# Altium schematic sheet 3V3_5V_LEVEL_SHIFTER.SchDoc
size A4; SheetNumber: 9; SheetTotal: 9
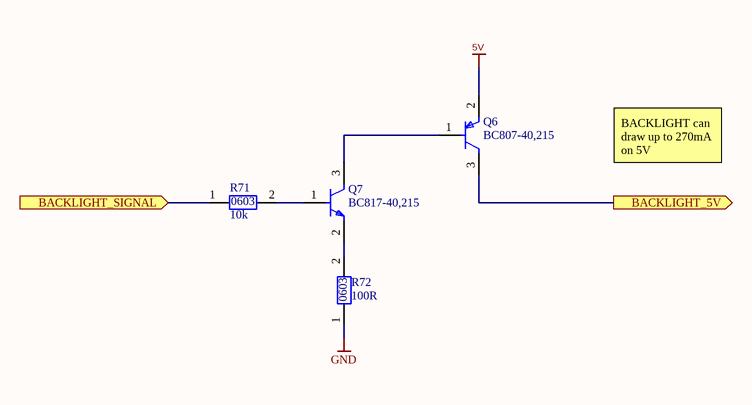
[diagram p0: 3V3_5V_LEVEL_SHIFTER.SchDoc]

## Parts
Q6  BC807-40,215  [FP-SOT23-IPC_B]
Q7  BC817-40,215  [FP-SOT23-MFG]
R71  SMD 0603 Resistor  [RESISTOR_SMD_0603]  (value not drawn)
R72  SMD 0603 Resistor  [RESISTOR_SMD_0603]  (value not drawn)

## Ports
BACKLIGHT_5V (out, see MAIN_SCHEMATIC[3A]), BACKLIGHT_SIGNAL (in, see MAIN_SCHEMATIC[2A], STM32[2B])

## Nets
5V: Q6.2(E)
GND: R72.1
BACKLIGHT_5V: Q6.3(C) ; port BACKLIGHT_5V
BACKLIGHT_SIGNAL: R71.1 ; port BACKLIGHT_SIGNAL
NetQ6_1: Q6.1(B) Q7.3(C)
NetQ7_1: Q7.1(B) R71.2
NetQ7_2: Q7.2(E) R72.2

## Notes on the sheet
- (near R71) 10k
- BACKLIGHT can draw up to 270mA on 5V
- (near R72) 100R
- (in symbol SMD 0603 Resistor) 0603

## Library data of the parts
Q6 = CMP-14406-000042-1: TRANS PNP 45V 500MA TO236AB; RoHS Compliant: Yes
Q7 = CMP-14406-000007-1: TRANS NPN 45V 0.5A SOT23; Manufacturer: Nexperia; Collector Emitter Saturation Voltage: 700mV; Power Dissipation: 250mW; Collector Base Voltage: 50V; Unity Gain Freq: 100MHz; Hfe Max: 600; Rthja Max: 500K/W; Emitter Base Voltage: 5V; Max Collector Current: 500mA; Hfe Testvce: 1V; Automotive Grade: Grade 0; Hfe Min: 250; Max Junction Temp: +150°C; Number Of Npn: 1; Hfe Testic: 100mA; Octopart: https://octopart.com/bc817-40%2C215-nexperia-78739081; Lead Free: Yes; Ipc Land Pattern Name: SOT95P230X100-3; Manufacturer Part Number: BC817-40,215; RoHS: TRUE; Collector Emitter Breakdown Voltage: 45V; Digikey Description: TRANS NPN 45V 0.5A SOT23; ComponentLink2URL: https://assets.nexperia.com/documents/data-sheet/BC817_SER.pdf; Temperature Range High: +150°C; Mouser Description: BC817 Series 45 V 500 mA 250 mW SMT NPN General-Purpose Transistor - SOT-23-; Device Class L3: BJTs; Temperature: to +150°C; Height: 1.1mm; Automotive: Yes; Ambient Temperature Range Low: -65°C; Package: SOT23; Collector Emitter Voltage: 45V; Category: Trans; ComponentLink2Description: Datasheet; Device Class L2: Transistors; Ambient Temperature Range High: +150°C; Number Of Elements: 1; Device Class L1: Discrete Semiconductors; Footprint Url: https://assets.nexperia.com/documents/outline-drawing/SOT23.pdf
R71 R72 = SMD 0603 Resistor: 0603 resistor